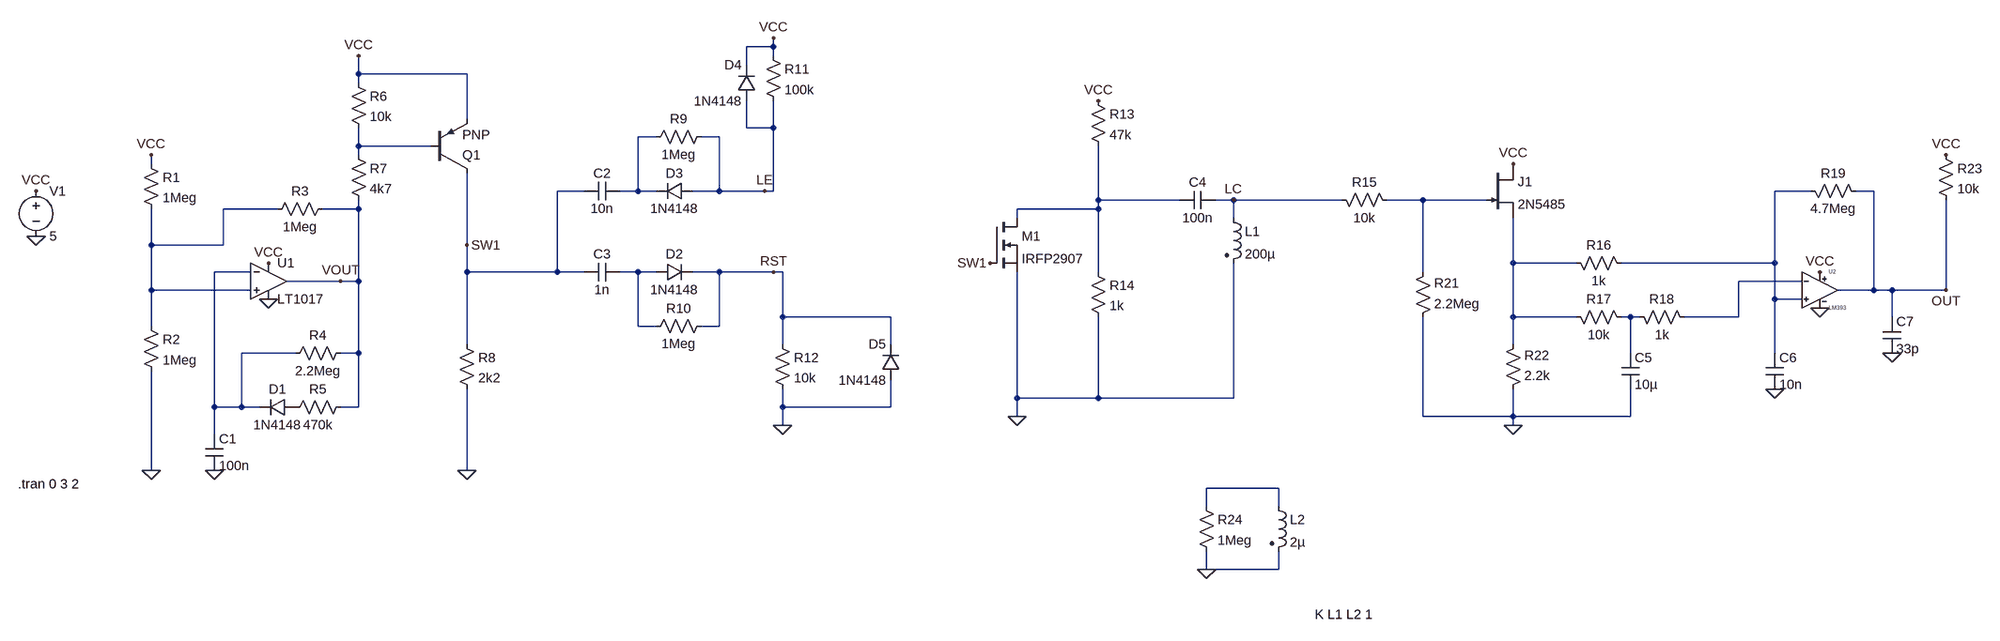
[diagram p0: schematic ring_tester.asc]
ring_tester.asc, the LTspice schematic file:
Version 4
SHEET 1 3780 800
WIRE 1104 -224 1104 -240
WIRE 1104 -224 1056 -224
WIRE 1104 -208 1104 -224
WIRE 1056 -192 1056 -224
WIRE 368 -176 368 -208
WIRE 560 -176 368 -176
WIRE 368 -160 368 -176
WIRE 560 -96 560 -176
WIRE 1056 -80 1056 -128
WIRE 1104 -80 1104 -128
WIRE 1104 -80 1056 -80
WIRE 896 -64 864 -64
WIRE 1008 -64 976 -64
WIRE 368 -48 368 -80
WIRE 496 -48 368 -48
WIRE 368 -32 368 -48
WIRE 0 -16 0 -32
WIRE 768 32 720 32
WIRE 864 32 864 -64
WIRE 864 32 832 32
WIRE 896 32 864 32
WIRE 1008 32 1008 -64
WIRE 1008 32 960 32
WIRE 1088 32 1008 32
WIRE 1104 32 1104 -80
WIRE 1104 32 1088 32
WIRE 2976 32 2912 32
WIRE 3088 32 3056 32
WIRE 1712 48 1712 -48
WIRE 1856 48 1712 48
WIRE 1952 48 1920 48
WIRE 2144 48 1952 48
WIRE 2288 48 2224 48
WIRE 2400 48 2288 48
WIRE 224 64 128 64
WIRE 368 64 368 48
WIRE 368 64 304 64
WIRE 1712 64 1712 48
WIRE 1712 64 1568 64
WIRE 1568 80 1568 64
WIRE 1952 80 1952 48
WIRE 0 128 0 64
WIRE 128 128 128 64
WIRE 128 128 0 128
WIRE 560 128 560 0
WIRE 2448 160 2448 80
WIRE 2560 160 2448 160
WIRE 2912 160 2912 32
WIRE 2912 160 2640 160
WIRE 176 176 112 176
WIRE 560 176 560 128
WIRE 720 176 720 32
WIRE 720 176 560 176
WIRE 768 176 720 176
WIRE 864 176 832 176
WIRE 896 176 864 176
WIRE 1008 176 960 176
WIRE 1104 176 1008 176
WIRE 1120 176 1104 176
WIRE 1712 176 1712 64
WIRE 2288 176 2288 48
WIRE 336 192 240 192
WIRE 368 192 368 64
WIRE 368 192 336 192
WIRE 2960 192 2848 192
WIRE 0 208 0 128
WIRE 176 208 0 208
WIRE 3088 208 3088 32
WIRE 3088 208 3024 208
WIRE 3120 208 3088 208
WIRE 3216 208 3216 48
WIRE 3216 208 3120 208
WIRE 2912 224 2912 160
WIRE 2960 224 2912 224
WIRE 1120 256 1120 176
WIRE 1312 256 1120 256
WIRE 2448 256 2448 160
WIRE 2560 256 2448 256
WIRE 2656 256 2640 256
WIRE 2672 256 2656 256
WIRE 2848 256 2848 192
WIRE 2848 256 2752 256
WIRE 3120 256 3120 208
WIRE 0 272 0 208
WIRE 864 272 864 176
WIRE 896 272 864 272
WIRE 1008 272 1008 176
WIRE 1008 272 976 272
WIRE 560 304 560 176
WIRE 1120 304 1120 256
WIRE 1312 304 1312 256
WIRE 2448 304 2448 256
WIRE 256 320 160 320
WIRE 368 320 368 192
WIRE 368 320 336 320
WIRE 2656 320 2656 256
WIRE 2912 320 2912 224
WIRE 1568 400 1568 176
WIRE 1712 400 1712 256
WIRE 1712 400 1568 400
WIRE 1952 400 1952 160
WIRE 1952 400 1712 400
WIRE 112 416 112 176
WIRE 160 416 160 320
WIRE 160 416 112 416
WIRE 192 416 160 416
WIRE 368 416 368 320
WIRE 368 416 336 416
WIRE 1120 416 1120 384
WIRE 1312 416 1312 368
WIRE 1312 416 1120 416
WIRE 1568 432 1568 400
WIRE 2288 432 2288 256
WIRE 2448 432 2448 384
WIRE 2448 432 2288 432
WIRE 2656 432 2656 384
WIRE 2656 432 2448 432
WIRE 1120 448 1120 416
WIRE 2448 448 2448 432
WIRE 112 464 112 416
WIRE 0 528 0 352
WIRE 560 528 560 384
WIRE 2032 560 1904 560
WIRE 1904 592 1904 560
WIRE 2032 592 2032 560
WIRE 1904 704 1904 672
WIRE 2032 704 2032 672
WIRE 2032 704 1904 704
FLAG -416 112 0
FLAG 208 224 0
FLAG -416 32 VCC
FLAG 208 160 VCC
FLAG 0 -32 VCC
FLAG 112 528 0
FLAG 0 528 0
FLAG 336 192 VOUT
FLAG 368 -208 VCC
FLAG 560 528 0
FLAG 1104 -240 VCC
FLAG 1120 448 0
FLAG 560 128 SW1
FLAG 1088 32 LE
FLAG 1104 176 RST
FLAG 1568 432 0
FLAG 1520 160 SW1
FLAG 1712 -128 VCC
FLAG 1952 48 LC
FLAG 2992 176 VCC
FLAG 2992 240 0
FLAG 2448 448 0
FLAG 3216 -32 VCC
FLAG 2448 -16 VCC
FLAG 2912 384 0
FLAG 3216 208 OUT
FLAG 1904 704 0
FLAG 3120 320 0
SYMBOL Comparators\\LT1017 208 192 R0
SYMATTR InstName U1
SYMBOL cap 96 464 R0
SYMATTR InstName C1
SYMATTR Value 100n
SYMBOL res -16 -32 R0
SYMATTR InstName R1
SYMATTR Value 1Meg
SYMBOL res -16 256 R0
SYMATTR InstName R2
SYMATTR Value 1Meg
SYMBOL res 320 48 R90
WINDOW 0 0 56 VBottom 2
WINDOW 3 32 56 VTop 2
SYMATTR InstName R3
SYMATTR Value 1Meg
SYMBOL res 352 304 R90
WINDOW 0 0 56 VBottom 2
WINDOW 3 32 56 VTop 2
SYMATTR InstName R4
SYMATTR Value 2.2Meg
SYMBOL res 352 400 R90
WINDOW 0 0 56 VBottom 2
WINDOW 3 32 56 VTop 2
SYMATTR InstName R5
SYMATTR Value 470k
SYMBOL voltage -416 16 R0
WINDOW 123 0 0 Left 0
WINDOW 39 0 0 Left 0
SYMATTR InstName V1
SYMATTR Value 5
SYMBOL diode 256 400 R90
WINDOW 0 0 32 VBottom 2
WINDOW 3 32 32 VTop 2
SYMATTR InstName D1
SYMATTR Value 1N4148
SYMBOL res 352 -176 R0
SYMATTR InstName R6
SYMATTR Value 10k
SYMBOL res 352 -48 R0
SYMATTR InstName R7
SYMATTR Value 4k7
SYMBOL pnp 496 0 M180
SYMATTR InstName Q1
SYMBOL res 544 288 R0
SYMATTR InstName R8
SYMATTR Value 2k2
SYMBOL cap 832 16 R90
WINDOW 0 0 32 VBottom 2
WINDOW 3 32 32 VTop 2
SYMATTR InstName C2
SYMATTR Value 10n
SYMBOL cap 832 160 R90
WINDOW 0 0 32 VBottom 2
WINDOW 3 32 32 VTop 2
SYMATTR InstName C3
SYMATTR Value 1n
SYMBOL diode 896 192 R270
WINDOW 0 32 32 VTop 2
WINDOW 3 0 32 VBottom 2
SYMATTR InstName D2
SYMATTR Value 1N4148
SYMBOL diode 960 16 R90
WINDOW 0 0 32 VBottom 2
WINDOW 3 32 32 VTop 2
SYMATTR InstName D3
SYMATTR Value 1N4148
SYMBOL res 992 -80 R90
WINDOW 0 0 56 VBottom 2
WINDOW 3 32 56 VTop 2
SYMATTR InstName R9
SYMATTR Value 1Meg
SYMBOL res 992 256 R90
WINDOW 0 0 56 VBottom 2
WINDOW 3 32 56 VTop 2
SYMATTR InstName R10
SYMATTR Value 1Meg
SYMBOL res 1088 -224 R0
SYMATTR InstName R11
SYMATTR Value 100k
SYMBOL res 1104 288 R0
SYMATTR InstName R12
SYMATTR Value 10k
SYMBOL diode 1072 -128 R180
WINDOW 0 24 64 Left 2
WINDOW 3 24 0 Left 2
SYMATTR InstName D4
SYMATTR Value 1N4148
SYMBOL diode 1328 368 R180
WINDOW 0 24 64 Left 2
WINDOW 3 24 0 Left 2
SYMATTR InstName D5
SYMATTR Value 1N4148
SYMBOL cap 1920 32 R90
WINDOW 0 0 32 VBottom 2
WINDOW 3 32 32 VTop 2
SYMATTR InstName C4
SYMATTR Value 100n
SYMBOL ind2 1936 64 R0
SYMATTR InstName L1
SYMATTR Value 200µ
SYMATTR Type ind
SYMATTR SpiceLine Rser=4
SYMBOL nmos 1520 80 R0
SYMATTR InstName M1
SYMATTR Value IRFP2907
SYMBOL res 1696 -144 R0
SYMATTR InstName R13
SYMATTR Value 47k
SYMBOL res 1696 160 R0
SYMATTR InstName R14
SYMATTR Value 1k
SYMBOL res 2128 32 M90
WINDOW 0 0 56 VBottom 2
WINDOW 3 32 56 VTop 2
SYMATTR InstName R15
SYMATTR Value 10k
SYMBOL res 2544 144 M90
WINDOW 0 0 56 VBottom 2
WINDOW 3 32 56 VTop 2
SYMATTR InstName R16
SYMATTR Value 1k
SYMBOL res 2544 240 M90
WINDOW 0 0 56 VBottom 2
WINDOW 3 32 56 VTop 2
SYMATTR InstName R17
SYMATTR Value 10k
SYMBOL res 2656 240 M90
WINDOW 0 0 56 VBottom 2
WINDOW 3 32 56 VTop 2
SYMATTR InstName R18
SYMATTR Value 1k
SYMBOL res 2960 16 M90
WINDOW 0 0 56 VBottom 2
WINDOW 3 32 56 VTop 2
SYMATTR InstName R19
SYMATTR Value 4.7Meg
SYMBOL res 2272 272 M180
WINDOW 0 36 76 Left 2
WINDOW 3 36 40 Left 2
SYMATTR InstName R21
SYMATTR Value 2.2Meg
SYMBOL res 2432 400 M180
WINDOW 0 36 76 Left 2
WINDOW 3 36 40 Left 2
SYMATTR InstName R22
SYMATTR Value 2.2k
SYMBOL njf 2400 -16 R0
SYMATTR InstName J1
SYMATTR Value 2N5485
SYMBOL cap 2640 320 R0
SYMATTR InstName C5
SYMATTR Value 10µ
SYMBOL LM393 2992 144 R0
SYMATTR InstName U2
SYMBOL res 3200 -48 R0
SYMATTR InstName R23
SYMATTR Value 10k
SYMBOL cap 2896 320 R0
SYMATTR InstName C6
SYMATTR Value 10n
SYMBOL ind2 2016 576 R0
SYMATTR InstName L2
SYMATTR Value 2µ
SYMATTR Type ind
SYMBOL res 1888 576 R0
SYMATTR InstName R24
SYMATTR Value 1Meg
SYMBOL cap 3104 256 R0
SYMATTR InstName C7
SYMATTR Value 33p
TEXT -448 552 Left 2 !.tran 0 3 2
TEXT 2096 784 Left 2 !K L1 L2 1

The netlist it stands for:
* ring_tester.asc
XU1 N006 N008 VCC 0 VOUT LT1017  ; pins In+ In- V+ V- OUT
C1 N008 0 100n
R1 VCC N006 1Meg
R2 N006 0 1Meg
R3 VOUT N006 1Meg
R4 VOUT N008 2.2Meg
R5 VOUT P001 470k
V1 VCC 0 5
D1 P001 N008 1N4148
R6 VCC N002 10k
R7 N002 VOUT 4k7
Q1 SW1 N002 VCC 0 PNP
R8 SW1 0 2k2
C2 N001 SW1 10n
C3 N009 SW1 1n
D2 N009 RST 1N4148
D3 LE N001 1N4148
R9 LE N001 1Meg
R10 RST N009 1Meg
R11 VCC LE 100k
R12 RST 0 10k
D4 LE VCC 1N4148
D5 0 RST 1N4148
C4 LC N004 100n
L1 LC 0 200µ Rser=4
M1 N004 SW1 0 0 IRFP2907
R13 VCC N004 47k
R14 N004 0 1k
R15 LC N005 10k
R16 N007 N003 1k
R17 N007 N011 10k
R18 N011 N010 1k
R19 N003 OUT 4.7Meg
R21 0 N005 2.2Meg
R22 0 N007 2.2k
J1 VCC N005 N007 2N5485
C5 N011 0 10µ
XU2 N003 N010 VCC 0 OUT LM2903B  ; pins IN+ IN- Vcc GND OUT
R23 VCC OUT 10k
C6 N003 0 10n
L2 N012 0 2µ
R24 N012 0 1Meg
C7 OUT 0 33p
.model D D
.lib standard.dio
.model NPN NPN
.model PNP PNP
.lib standard.bjt
.model NJF NJF
.model PJF PJF
.lib standard.jft
.model NMOS NMOS
.model PMOS PMOS
.lib standard.mos
.tran 0 3 2
K L1 L2 1
.lib LM393.lib
.backanno
.end